# Altium project Lamps_buttons.PrjPcb
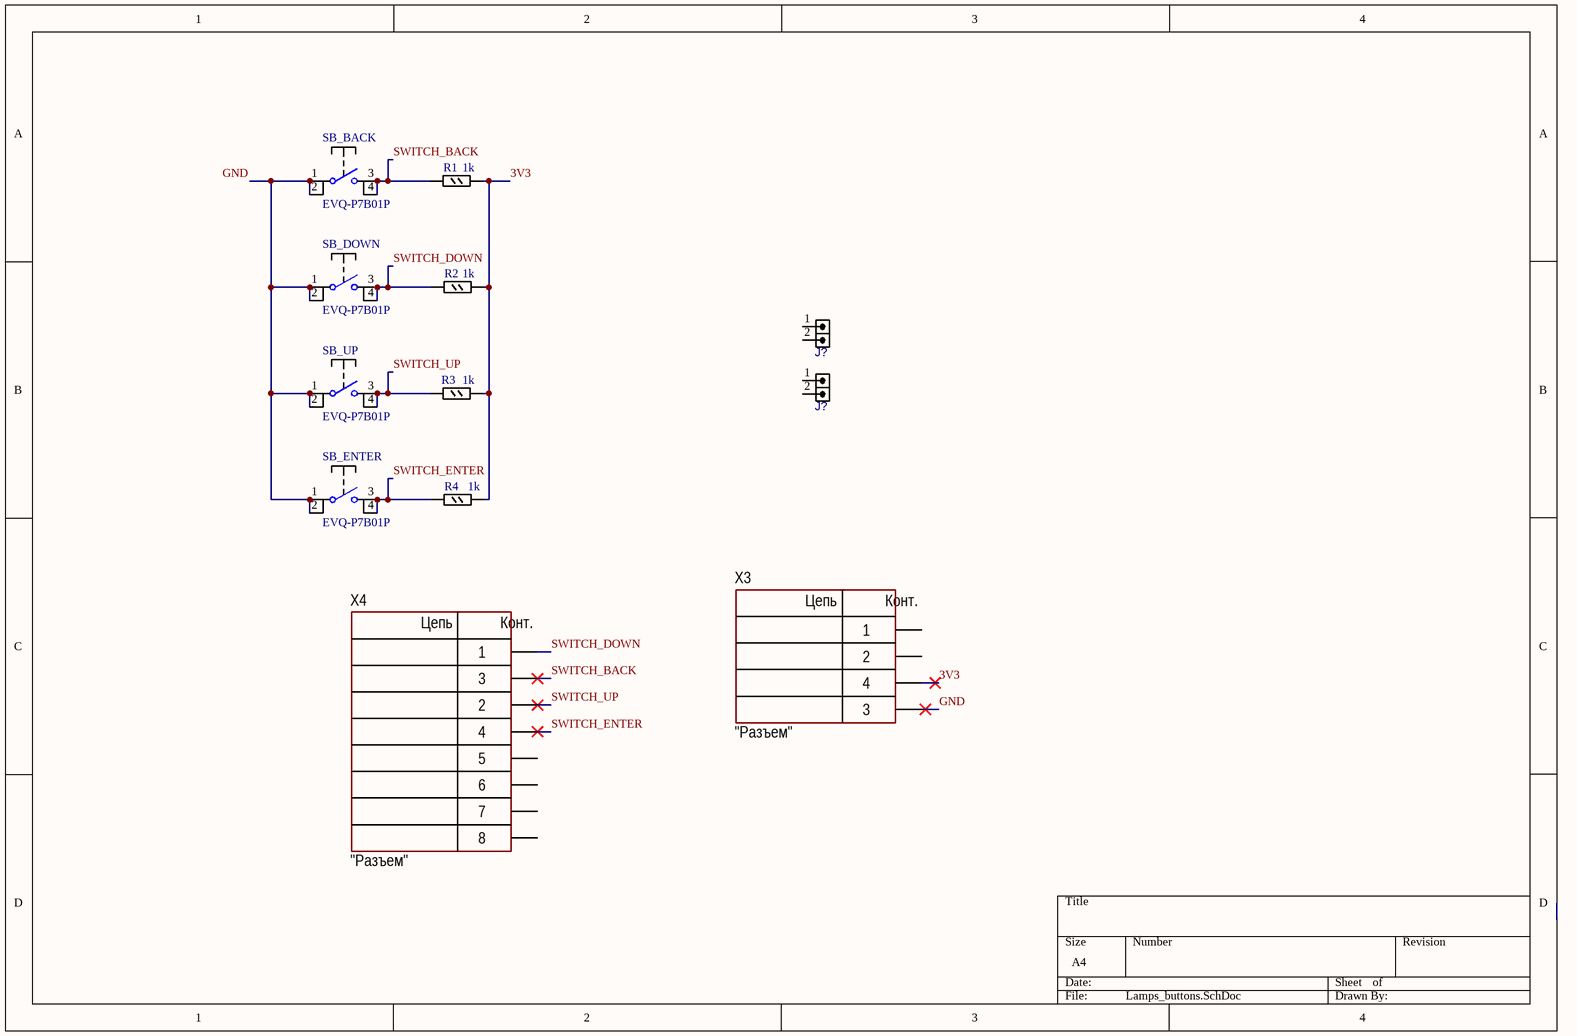
[diagram p0: Lamps_buttons.SchDoc]
1 sheet, 12 parts. Net scope: global (net labels, ports and power ports of the same name join across sheets).
Board file: Lamps_buttons.PcbDoc

## Sheet Lamps_buttons.SchDoc
size A4

### Parts
(Parts that share a designator on the sheet are numbered #1, #2 ... from top to bottom, then left to right.)
J?#1  HDRM2  [HDRSE_M_1X2]  (value not drawn)
J?#2  HDRM2  [HDRSE_M_1X2]  (value not drawn)
R1  1k  [RESC2012(0805)N]
R2  1k  [RESC2012(0805)N]
R3  1k  [RESC2012(0805)N]
R4  1k  [RESC2012(0805)N]
SB_BACK  EVQ-P7B01P  [SWPBT_SPDT_12X12SKHC]
SB_DOWN  EVQ-P7B01P  [SWPBT_SPDT_12X12SKHC]
SB_ENTER  EVQ-P7B01P  [SWPBT_SPDT_12X12SKHC]
SB_UP  EVQ-P7B01P  [SWPBT_SPDT_12X12SKHC]
X3  CommentText: "Разъем"  [CON: PLD-4]
X4  CommentText: "Разъем"  [CON: PLD-8]

### Nets
3V3: R1.2 R2.2 R3.2 R4.2 X3.4
GND: SB_BACK.1(COMMON) SB_BACK.2(NO) SB_DOWN.1(COMMON) SB_DOWN.2(NO) SB_ENTER.1(COMMON) SB_ENTER.2(NO) SB_UP.1(COMMON) SB_UP.2(NO) X3.3
SWITCH_BACK: R1.1 SB_BACK.3(COMMON) SB_BACK.4(COMMON) X4.3
SWITCH_DOWN: R2.1 SB_DOWN.3(COMMON) SB_DOWN.4(COMMON) X4.1
SWITCH_ENTER: R4.1 SB_ENTER.3(COMMON) SB_ENTER.4(COMMON) X4.4
SWITCH_UP: R3.1 SB_UP.3(COMMON) SB_UP.4(COMMON) X4.2

Not connected (* = marked no-connect by the designer): J?#1 1(P1) 2(P2); J?#2 1(P1) 2(P2); X3 1 2; X4 5 6 7 8

### Notes on the sheet
- (in symbol PBD-4) Цепь; Конт.
- (in symbol PBD-8) Цепь; Конт.

### Library data of the parts
J?#1 J?#2 = HDRSE_M_1X2: CONN, HEADER, Male, pitch: 2.54mm, 2POS, SMD; MANF_P#: PBC36SAAN; MANF: Sullins; DESC: DESCRIPTION; ASSEMBLY: ASSEMBLY; PARAM: PARAM; PRICE: PRICE; VALUE: HDRM2
R1-R4 = RESC2012(0805): Part Number: RESC2012(0805); Package: 0805
SB_BACK SB_DOWN SB_ENTER SB_UP = EVQ-P7B01P: SWITCH TACTILE SPST-NO 0.05A 12V; pin to pad: 2>4 3>2 4>3; Part Number: EVQ-P7B01P; HelpURL: https://www.digikey.com/product-detail/en/EVQ-P7B01P/P16764CT-ND/4429457/?itemSeq=274049127; Digi-Key Part Number: P16764CT-ND; Price$: 0.16200; Manufacturer Part Number: EVQ-P7B01P; Package: 4pinSMD
X3 = PBD-4: Manufacturer: Connfly; ValueManufacturerPartNumber: Connector, 4pin, 2.54mm, 500VAC, 3A; TypeConnector: Connector; VoltageMax: 500VAC; Pitch: 2.54mm; CurrentMax: 3A; Multichannel: 4pin; HelpURL: https://www.chipdip.ru/product/pbd-4; PartNumber: PBD-4; System: Connector
X4 = PBD-8: Manufacturer: Connfly; ValueManufacturerPartNumber: Connector, 8pin, 2.54mm, 500VAC, 3A; TypeConnector: Connector; VoltageMax: 500VAC; Pitch: 2.54mm; CurrentMax: 3A; Multichannel: 8pin; HelpURL: https://www.chipdip.ru/product/pbd-8; PartNumber: PBD-8; System: Connector